# Altium schematic sheet UARTtoRS485.SchDoc
size 209 x 297 mm; SheetNumber: 3; SheetTotal: 3; SPICEModelCacheQAQBARVM: <root> / <DocumentId>QAQBARVM</DocumentId> / <CacheFrame Number="0"> / <Model Name="my_lib_r_tcr" Kind="CKT"> / <Text>* MY_LIB first-order resistor temperature model. / * Component data source ONLY: YAGEO RC_L, Nov. 14 2025 V.14. / * Table 2, page 5: RC0603 0.1W / RC0805 0.125W, 1 and 5 percent: / * 1 &lt;= R &lt;= 10 ohms: +/-200 ppm/C; 10 ohms &lt; R &lt;= 1 megohm: +/-100 ppm/C. / * The user selected the POSITIVE specification limit for simulation. / * This is a linear corner estimate, NOT a measured or typical TCR. / * Table 5, page 8: reference +25 C, TCR tested at -55 C and +125 C. / * R(T) = Rvalue * (1 + TC1value * (T - 25 C)). TC1value is per degree C. / * Rated operating range is -55..155 C; above +125 C this linear model / * extrapolates the TCR test interval, not a guaranteed measured curve. / * No self-heating, initial tolerance, aging or power limiting is modeled. / * Jumper TCR is not specified; 0R components keep their separate model. / .SUBCKT MY_LIB_R_TCR 1 2 PARAMS: Rvalue=1 TC1value=0 / Rthermal 1 2 RTCR {Rvalue} / .MODEL RTCR R (TC1={TC1value} TNOM=25) / .ENDS MY_LIB_R_TCR</Text> / </Model> / </CacheFrame> / </root>
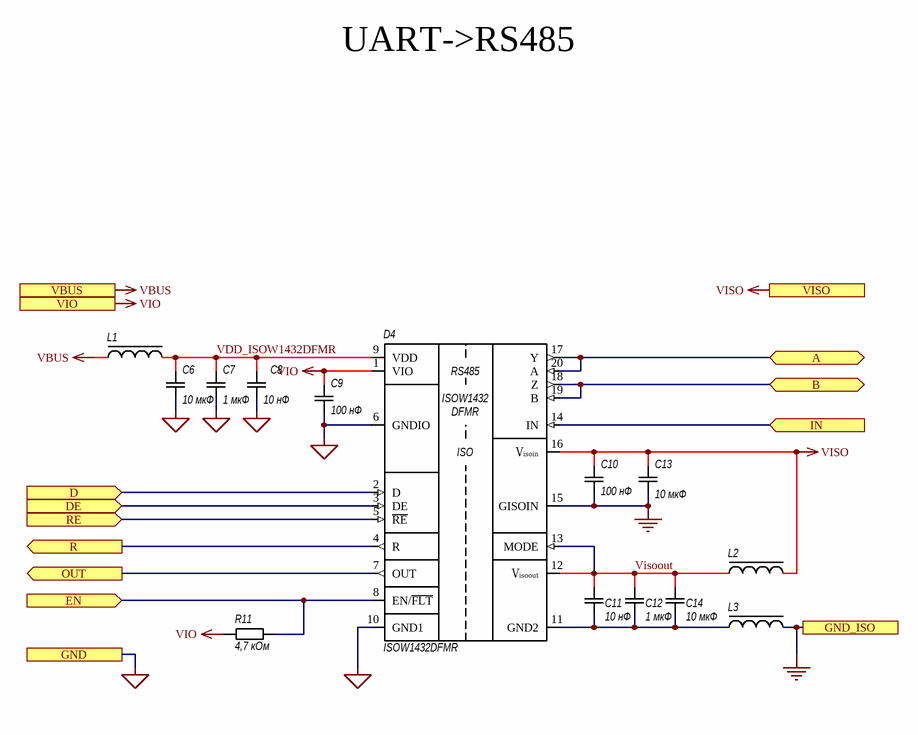
[diagram p0: UARTtoRS485.SchDoc]

## Parts
C6  10 мкФ  [CAPC2012X135N]
C7  1 мкФ  [CAPC2012X135N]
C8  10 нФ  [CAPC1608X90N]
C9  100 нФ  [CAPC2012X135N]
C10  100 нФ  [CAPC2012X135N]
C11  10 нФ  [CAPC1608X90N]
C12  1 мкФ  [CAPC2012X135N]
C13  10 мкФ  [CAPC2012X135N]
C14  10 мкФ  [CAPC2012X135N]
D4  ISOW1432DFMR  [TI_DFM0020A]
L1  600 Ом @ 100 МГц  [TDK_MPZ2012S_2012]  (value not drawn)
L2  330 Ом @ 100 МГц  [Murata_BLM21PG_2012_Reflow]  (value not drawn)
L3  330 Ом @ 100 МГц  [Murata_BLM21PG_2012_Reflow]  (value not drawn)
R11  4,7 кОм  [RESC2012X70N]

## Ports
A (bidir, see MAIN[2A]), B (bidir, see MAIN[2A]), D (in, see MAIN[2A]), DE (in, see MAIN[2A]), EN (in, see MAIN[2A]), GND (see MAIN[2A], USBtoUART[1A]), GND_ISO (see MAIN[2A]), IN (in, see MAIN[2A]), OUT (out, see MAIN[2A]), R (out, see MAIN[2A]), RE (in, see MAIN[2A]), VBUS (in, see MAIN[2A], USBtoUART[1A]), VIO (in, see MAIN[2A], USBtoUART[1A]), VISO (out, see MAIN[2A])

## Nets
GND: C6.1 C7.1 C8.1 C9.1 D4.6(GNDIO) D4.10(GND1) ; port GND
GND_ISO: C10.1 C13.1 D4.15(GISOIN) L3.1 ; port GND_ISO
VBUS: L1.2 ; port VBUS
VIO: C9.2 D4.1(VIO) R11.2 ; port VIO
VISO: C10.2 C13.2 D4.16(Vᵢₛₒᵢₙ) L2.1 ; port VISO
A: D4.17(Y) D4.20(A) ; port A
B: D4.18(Z) D4.19(B) ; port B
D: D4.2(D) ; port D
DE: D4.3(DE) ; port DE
EN: D4.8(EN/~{FLT}) R11.1 ; port EN
IN: D4.14(IN) ; port IN
OUT: D4.7(OUT) ; port OUT
R: D4.4(R) ; port R
RE: D4.5(~{RE}) ; port RE
VDD_ISOW1432DFMR: C6.2 C7.2 C8.2 D4.9(VDD) L1.1
Visoout: C11.2 C12.2 C14.2 D4.12(Vᵢₛₒₒᵤₜ) D4.13(MODE) L2.2
NetC11_1: C11.1 C12.1 C14.1 D4.11(GND2) L3.2

## Notes on the sheet
- UART->RS485
- Подп. дата
- Инв. № дубл.
- Взам. инв. №
- Подп. и дата
- Инв. № подл.
- Изм.
- Лист
- № докум.
- Подп.
- Дата
- ALTIUM GOSTBOM2.0 KEV
- Копировал
- Формат А4
- (in symbol U0004) RS485; ISOW1432; DFMR; ISO

## Library data of the parts
C6 C13 C14 = C0141: Конденсатор 10 мкФ ±20% 16 В X7R 0805; Manufacturer: YAGEO; MPN: CC0805MKX7R7BB106; ID: C0141; Value: 10u; Voltage: 16 В; Notes: YAGEO CC; список 20.10.2026; CapacitanceNominalF: 1E-5; DissipationFactorMax: 0.1; DFTestFrequencyHz: 1000; DFTestVoltageVrms: 1; DFTestTemperatureC: 20; InsulationTimeConstantMinS: 100; InsulationResistanceMinOhm: 10000000; InsulationTestVoltageV: 16; InsulationTestDurationS: 60; EquivalentSeriesResistanceOhm: 1.59154943091895; Type: Конденсатор; ESKD_value: 10 мкФ; Tolerance: ±20%; Package: 0805; CommentBase: Конденсатор 10 мкФ ±20% 16 В X7R 0805; Dielectric: X7R; ComponentLink2URL: https://yageogroup.com/content/datasheet/asset/file/UPY-GPHC_X7R_6_3V-TO-250V; ComponentLink2Description: Даташит — производитель; HelpURL: C:\Users\Nomatin\Documents\Altium\MY_LIB\MY_LIB\Datasheets\YAGEO_CC_X7R.pdf; ComponentLink1URL: C:\Users\Nomatin\Documents\Altium\MY_LIB\MY_LIB\Datasheets\YAGEO_CC_X7R.pdf; ComponentLink1Description: Даташит — локальный; Datasheet: C:\Users\Nomatin\Documents\Altium\MY_LIB\MY_LIB\Datasheets\YAGEO_CC_X7R.pdf
C7 C12 = C0138: Конденсатор 1 мкФ ±20% 100 В X7R 0805; Manufacturer: YAGEO; MPN: CC0805MKX7R0BB105; ID: C0138; Value: 1u; Voltage: 100 В; Notes: YAGEO CC; список 20.10.2026; CapacitanceNominalF: 1E-6; DissipationFactorMax: 0.05; DFTestFrequencyHz: 1000; DFTestVoltageVrms: 1; DFTestTemperatureC: 20; InsulationTimeConstantMinS: 500; InsulationResistanceMinOhm: 500000000; InsulationTestVoltageV: 100; InsulationTestDurationS: 60; EquivalentSeriesResistanceOhm: 7.95774715459477; Type: Конденсатор; ESKD_value: 1 мкФ; Tolerance: ±20%; Package: 0805; CommentBase: Конденсатор 1 мкФ ±20% 100 В X7R 0805; Dielectric: X7R; ComponentLink2URL: https://yageogroup.com/content/datasheet/asset/file/UPY-GPHC_X7R_6_3V-TO-250V; ComponentLink2Description: Даташит — производитель; HelpURL: C:\Users\Nomatin\Documents\Altium\MY_LIB\MY_LIB\Datasheets\YAGEO_CC_X7R.pdf; ComponentLink1URL: C:\Users\Nomatin\Documents\Altium\MY_LIB\MY_LIB\Datasheets\YAGEO_CC_X7R.pdf; ComponentLink1Description: Даташит — локальный; Datasheet: C:\Users\Nomatin\Documents\Altium\MY_LIB\MY_LIB\Datasheets\YAGEO_CC_X7R.pdf
C8 C11 = C0219: Конденсатор 10 нФ ±10% 100 В X7R 0603; Manufacturer: YAGEO; MPN: CC0603KRX7R0BB103; ID: C0219; Value: 10n; Voltage: 100 В; Notes: YAGEO CC; список 20.10.2026; CapacitanceNominalF: 1E-8; DissipationFactorMax: 0.025; DFTestFrequencyHz: 1000; DFTestVoltageVrms: 1; DFTestTemperatureC: 20; InsulationTimeConstantMinS: 500; InsulationResistanceMinOhm: 10000000000; InsulationTestVoltageV: 100; InsulationTestDurationS: 60; EquivalentSeriesResistanceOhm: 397.887357729738; Type: Конденсатор; ESKD_value: 10 нФ; Tolerance: ±10%; Package: 0603; CommentBase: Конденсатор 10 нФ ±10% 100 В X7R 0603; Dielectric: X7R; ComponentLink2URL: https://yageogroup.com/content/datasheet/asset/file/UPY-GPHC_X7R_6_3V-TO-250V; ComponentLink2Description: Даташит — производитель; HelpURL: C:\Users\Nomatin\Documents\Altium\MY_LIB\MY_LIB\Datasheets\YAGEO_CC_X7R.pdf; ComponentLink1URL: C:\Users\Nomatin\Documents\Altium\MY_LIB\MY_LIB\Datasheets\YAGEO_CC_X7R.pdf; ComponentLink1Description: Даташит — локальный; Datasheet: C:\Users\Nomatin\Documents\Altium\MY_LIB\MY_LIB\Datasheets\YAGEO_CC_X7R.pdf
C9 C10 = C0094: Конденсатор 100 нФ ±10% 100 В X7R 0805; Manufacturer: YAGEO; MPN: CC0805KKX7R0BB104; ID: C0094; Value: 100n; Voltage: 100 В; Notes: YAGEO CC; список 20.10.2026; CapacitanceNominalF: 1E-7; DissipationFactorMax: 0.025; DFTestFrequencyHz: 1000; DFTestVoltageVrms: 1; DFTestTemperatureC: 20; InsulationTimeConstantMinS: 500; InsulationResistanceMinOhm: 5000000000; InsulationTestVoltageV: 100; InsulationTestDurationS: 60; EquivalentSeriesResistanceOhm: 39.7887357729738; Type: Конденсатор; ESKD_value: 100 нФ; Tolerance: ±10%; Package: 0805; CommentBase: Конденсатор 100 нФ ±10% 100 В X7R 0805; Dielectric: X7R; Datasheet: C:\Users\Nomatin\Documents\Altium\MY_LIB\MY_LIB\Datasheets\YAGEO_CC_X7R.pdf; ComponentLink1Description: Даташит — локальный; ComponentLink1URL: C:\Users\Nomatin\Documents\Altium\MY_LIB\MY_LIB\Datasheets\YAGEO_CC_X7R.pdf; ComponentLink2Description: Даташит — производитель; ComponentLink2URL: https://yageogroup.com/content/datasheet/asset/file/UPY-GPHC_X7R_6_3V-TO-250V; HelpURL: C:\Users\Nomatin\Documents\Altium\MY_LIB\MY_LIB\Datasheets\YAGEO_CC_X7R.pdf
D4 = U0004: Микросхема ISOW1432DFMR; Manufacturer: Texas Instruments; ID: U0004; Voltage: VIO: 1,71–1,89 / 2,25–5,5 В; VDD: 3–5,5 В; Notes: RS-485/RS-422 full duplex, 12 Мбит/с; DC-DC. Внешние соединения GNDIO/GND1, VISOOUT/VISOIN, GISOIN/GND2 — по TI.; TemperatureReference: TA (ambient), °C; recommended operating; JunctionTemperatureMin: -40; JunctionTemperatureMax: 150; Type: Микросхема; Value: ISOW1432DFMR; ESKD_value: ISOW1432DFMR; Package: SOIC-20 DFM (7,5×12,83 мм); MPN: ISOW1432DFMR; CommentBase: Микросхема ISOW1432DFMR; OperatingTemperatureMin: -40; OperatingTemperatureMax: 125; StorageTemperatureMin: -65; StorageTemperatureMax: 150; Datasheet: C:\Users\Nomatin\Documents\Altium\MY_LIB\MY_LIB\Datasheets\ISOW1432_TI.pdf; DatasheetRevision: SLLSF86D, August 2026; ComponentLink1Description: Даташит — локальный; ComponentLink1URL: C:\Users\Nomatin\Documents\Altium\MY_LIB\MY_LIB\Datasheets\ISOW1432_TI.pdf; ComponentLink2Description: Даташит — производитель; ComponentLink2URL: https://www.ti.com/lit/ds/symlink/isow1432.pdf; HelpURL: C:\Users\Nomatin\Documents\Altium\MY_LIB\MY_LIB\Datasheets\ISOW1432_TI.pdf
L1 = L0005: Ферритовый фильтр MPZ2012S601AT000; Manufacturer: TDK; ID: L0005; Tolerance: ±25%; Notes: Неполярный; выводы 1–2. Импеданс при 100 МГц; DCR — начальное максимальное значение. Ток номинальный при температуре компонента до 85 °C; выше — снижение по графику. Температура включает саморазогрев.; ImpedanceOhm: 600; TestFrequencyMHz: 100; RatedCurrentA: 2; DCResistanceMaxOhm: 0.1; TemperatureReference: Component temperature including self-heating, °C; current derating above 85°C; Grade: Commercial; PackagingQuantity: 4000; SimulationModelSource: MY_LIB; S-parameters and sampled TDK Precise outputs; SimulationModelType: Independent passive black-box RLC; SimulationReferenceTemperatureC: 25; SimulationDCBiasCurrentA: 0; SimulationSignalCondition: Small signal; Value: 600 Ом @ 100 МГц; Type: Ферритовый фильтр; ESKD_value: 600 Ом @ 100 МГц; Package: 0805; MPN: MPZ2012S601AT000; CommentBase: Ферритовый фильтр MPZ2012S601AT000; Datasheet: C:\Users\Nomatin\Documents\Altium\MY_LIB\MY_LIB\Datasheets\Ferrite_Beads\TDK_MPZ2012_commercial.pdf; ComponentLink1Description: Даташит — локальный; ComponentLink1URL: C:\Users\Nomatin\Documents\Altium\MY_LIB\MY_LIB\Datasheets\Ferrite_Beads\TDK_MPZ2012_commercial.pdf; ComponentLink2Description: Даташит — производитель; ComponentLink2URL: https://product.tdk.com/en/system/files/dam/doc/product/emc/emc/beads/catalog/beads_commercial_power_mpz2012_en.pdf; HelpURL: C:\Users\Nomatin\Documents\Altium\MY_LIB\MY_LIB\Datasheets\Ferrite_Beads\TDK_MPZ2012_commercial.pdf; OperatingTemperatureMin: -55; OperatingTemperatureMax: 125; Family: MPZ2012S; Packaging: 180 mm paper tape; DatasheetRevision: 2019-04-24
L2 L3 = L0028: Ферритовый фильтр BLM21PG331SN1D; Manufacturer: Murata; ID: L0028; Tolerance: ±25%; Notes: Неполярный; выводы 1–2. Импеданс при 100 МГц; DCR — начальное максимальное значение. Ток указан при TA=85 °C, отдельное поле — при TA=125 °C; выше 85 °C требуется снижение тока. Ширину подводящей меди выбирать по даташиту с учётом тока и толщины меди.; ImpedanceOhm: 330; TestFrequencyMHz: 100; RatedCurrentA: 1.5; RatedCurrent125CA: 1; DCResistanceMaxOhm: 0.07; TemperatureReference: TA, °C; rated current at 85°C / 125°C; Grade: Consumer/industrial; PackagingQuantity: 4000; SimulationModelSource: MY_LIB; sampled Murata SPICE outputs; S-parameter comparison; SimulationModelType: Independent passive black-box RLC; SimulationReferenceTemperatureC: 25; SimulationDCBiasCurrentA: 0; SimulationSignalCondition: Small signal; Value: 330 Ом @ 100 МГц; Type: Ферритовый фильтр; ESKD_value: 330 Ом @ 100 МГц; Package: 0805; MPN: BLM21PG331SN1D; CommentBase: Ферритовый фильтр BLM21PG331SN1D; Datasheet: C:\Users\Nomatin\Documents\Altium\MY_LIB\MY_LIB\Datasheets\Ferrite_Beads\Murata_ENFA0005.pdf; ComponentLink1Description: Даташит — локальный; ComponentLink1URL: C:\Users\Nomatin\Documents\Altium\MY_LIB\MY_LIB\Datasheets\Ferrite_Beads\Murata_ENFA0005.pdf; ComponentLink2Description: Даташит — производитель; ComponentLink2URL: https://www.murata.com/products/productdata/8796738977822/ENFA0005.pdf; HelpURL: C:\Users\Nomatin\Documents\Altium\MY_LIB\MY_LIB\Datasheets\Ferrite_Beads\Murata_ENFA0005.pdf; OperatingTemperatureMin: -55; OperatingTemperatureMax: 125; Family: BLM21PG; Packaging: 180 mm paper tape; DatasheetRevision: JENF243A_0005AE-01
R11 = R0242: Резистор 4,7 кОм ±5% 0805; Manufacturer: YAGEO; MPN: RC0805JR-074K7L; ID: R0242; Value: 4.7k; Power: 0,125 Вт; Voltage: 150 В макс.; Notes: RC_L; E24; P при 70 °C; SPICE: +100 ppm/°C при 25 °C — положительная граница ±100, не измеренный ТКС (RC_L, табл.2/5, стр.5/8).; TCR: ±100 ppm/°C; Type: Резистор; ESKD_value: 4,7 кОм; Tolerance: ±5%; Package: 0805; CommentBase: Резистор 4,7 кОм ±5% 0805; ComponentLink2URL: https://yageogroup.com/content/datasheet/asset/file/PYU-RC_GROUP_51_ROHS_L; ComponentLink2Description: Даташит — производитель; HelpURL: C:\Users\Nomatin\Documents\Altium\MY_LIB\MY_LIB\Datasheets\YAGEO_RC_L.pdf; ComponentLink1URL: C:\Users\Nomatin\Documents\Altium\MY_LIB\MY_LIB\Datasheets\YAGEO_RC_L.pdf; ComponentLink1Description: Даташит — локальный; Datasheet: C:\Users\Nomatin\Documents\Altium\MY_LIB\MY_LIB\Datasheets\YAGEO_RC_L.pdf